# EAGLE design PBC_SISTEMA_ADQUISICION (EAGLE 9.6.2)
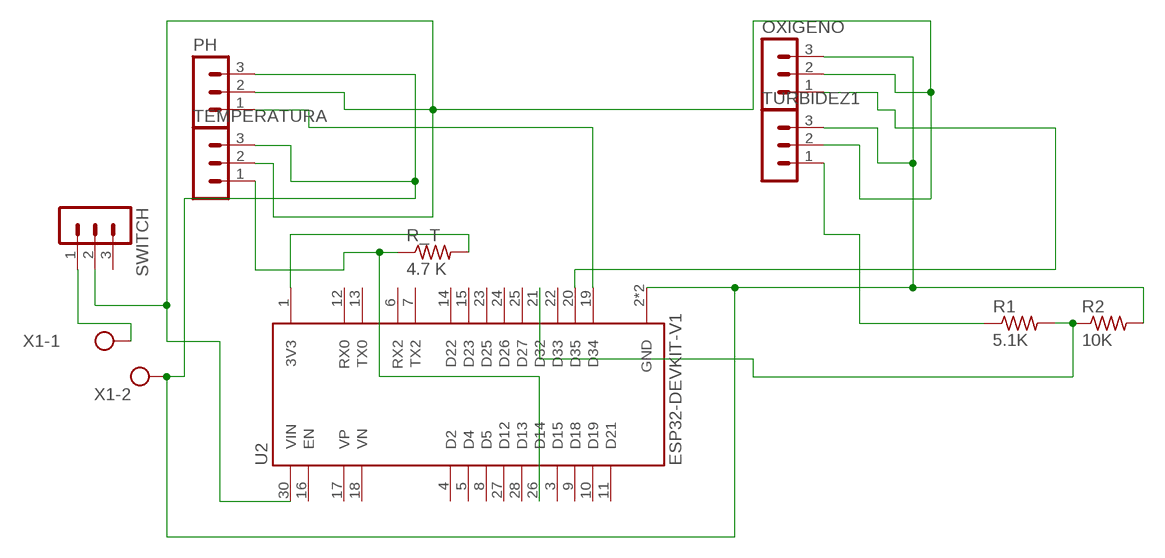
[diagram p0: schematic, sheet 1]

## Parts
OXIGENO  MA03-1  [MA03-1]
PH  MA03-1  [MA03-1]
R1  5.1K  R-US_0207/7  [0207/7]
R2  10K  R-US_0207/7  [0207/7]
R_T  4.7 K  R-US_0207/7  [0207/7]
SWITCH  MA03-1  [MA03-1]
TEMPERATURA  MA03-1  [MA03-1]
TURBIDEZ1  MA03-1  [MA03-1]
U2  ESP32-DEVKIT-V1  [MODULE_ESP32_DEVKIT_V1]
X1  W237-102  [W237-102]

## Nets
GND: OXIGENO.3 PH.3 R2.2 TEMPERATURA.3 TURBIDEZ1.3 U2.2(GND) U2.29(GND) X1.2
N$2: R1.2 R2.1 U2.21(D32)
N$3: OXIGENO.2 PH.2 SWITCH.2 TEMPERATURA.2 TURBIDEZ1.2 U2.30(VIN)
N$4: OXIGENO.1 U2.20(D35)
N$5: R1.1 TURBIDEZ1.1
N$6: PH.1 U2.19(D34)
N$7: R_T.2 U2.1(3V3)
N$9: R_T.1 TEMPERATURA.1 U2.26(D14)
N$13: SWITCH.1 X1.1
Unconnected: SWITCH.3 U2.3(D15) U2.4(D2) U2.5(D4) U2.6(RX2) U2.7(TX2) U2.8(D5) U2.9(D18) U2.10(D19) U2.11(D21) U2.12(RX0) U2.13(TX0) U2.14(D22) U2.15(D23) U2.16(EN) U2.17(VP) U2.18(VN) U2.22(D33) U2.23(D25) U2.24(D26) U2.25(D27) U2.27(D12) U2.28(D13)

## Library data of the parts
OXIGENO PH SWITCH TEMPERATURA TURBIDEZ1 = con-lstb:MA03-1: PIN HEADER; OC_FARNELL: unknown; OC_NEWARK: unknown
R1 R2 R_T = rcl:R-US_: RESISTOR, American symbol; SPICEPREFIX: R
U2 = ESP32-DEVKIT-V1:ESP32-DEVKIT-V1: Check availability <https://pricing.snapeda.com/parts/ESP32-DEVKIT-V1/Do%20it/view-part?ref=eda>; AVAILABILITY: Not in stock; CHECK_PRICES: https://www.snapeda.com/parts/ESP32-DEVKIT-V1/Do+it/view-part/?ref=eda; DESCRIPTION: Dual core, Wi-Fi: 2.4 GHz up to 150 Mbits/s,BLE (Bluetooth Low Energy) and legacy Bluetooth, 32 bits, Up to 240 MHz; MF: Do it; MP: ESP32-DEVKIT-V1; PACKAGE: None; PRICE: None; SNAPEDA_LINK: https://www.snapeda.com/parts/ESP32-DEVKIT-V1/Do+it/view-part/?ref=snap
X1 = con-wago-500:W237-102: WAGO SCREW CLAMP; MPN: 237-102; OC_FARNELL: unknown; OC_NEWARK: 70K9898

## Board
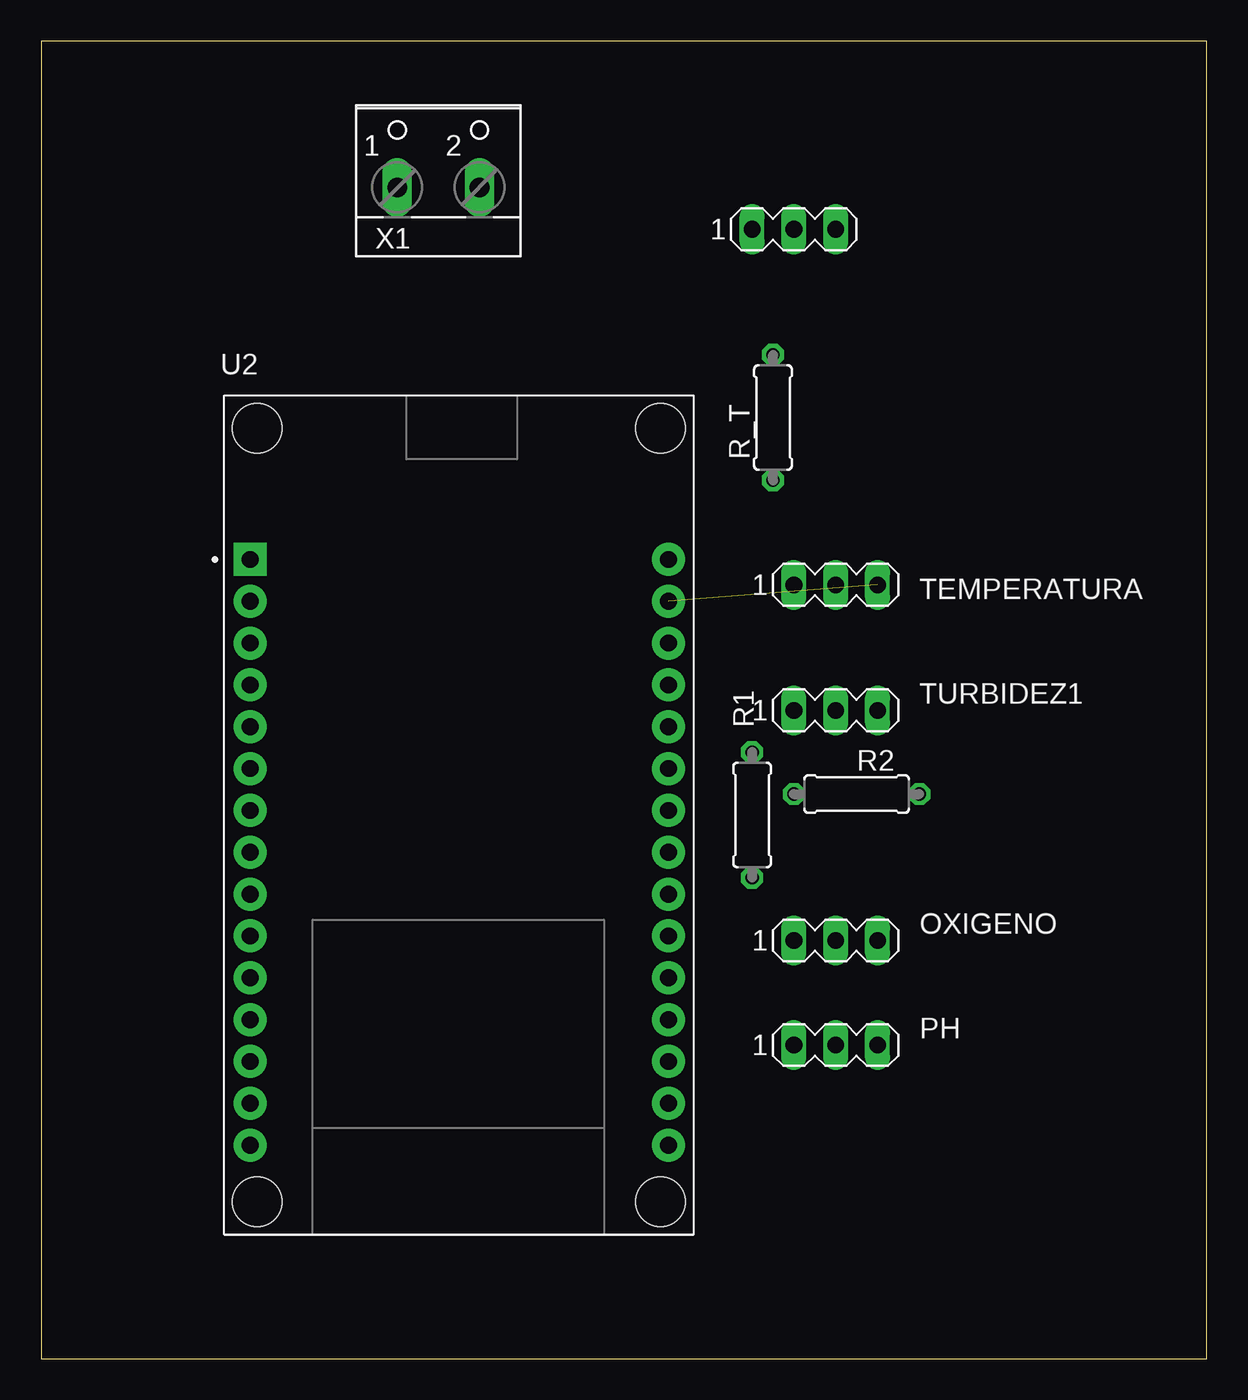
[diagram p1: board, top side]
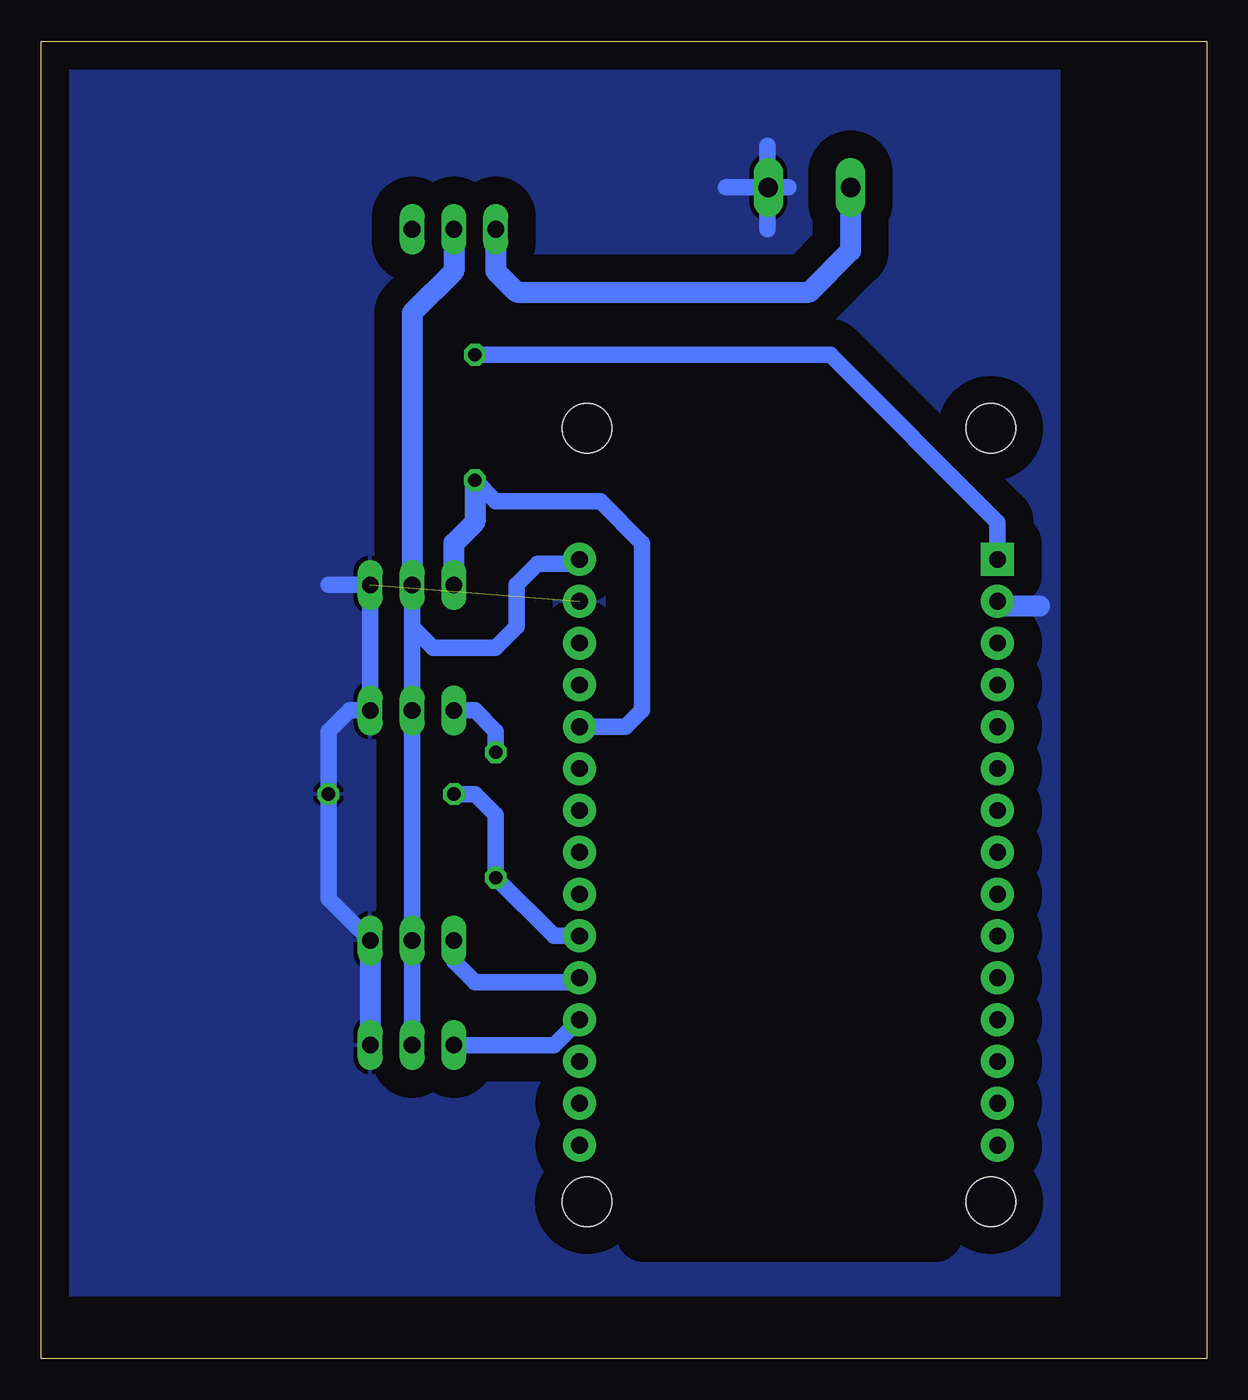
[diagram p2: board, bottom side, seen from below]

Size 70.79 x 80 mm. Coordinates in mm from the lower left corner, seen from the top.
Outline: 0,0 70.79,0 70.79,80 0,80 0,0
Copper layers (1*16): Top 0.035mm / dielectric 1.5mm / Bottom 0.035mm
Design rules "default *": minimum track width 6mil, minimum drill 0.35mm, track to track 6mil, track to pad 6mil, pad to pad 6mil, via to via 6mil, smd to smd 6mil, copper to edge 40mil, drill to drill 6mil, minimum pad ring 10mil, minimum via ring 8mil, stop-mask expansion 4mil, vias tented up to drill 0mil, thermal gap 10mil

### Footprints (pad centres in the part's own frame; a part is rotated, then mirrored left to right if it is on the bottom)
MA03-1 = drill 1.016 long: 1 -2.54,0; 2 0,0; 3 2.54,0
0207/7 = drill 0.813 octagon: 1 -3.81,0; 2 3.81,0
MODULE_ESP32_DEVKIT_V1 = drill 1.02 pad 2 square: 1 -12.7,15.515 | drill 1.02 pad 2: 2 -12.7,12.975; 3 -12.7,10.435; 4 -12.7,7.895; 5 -12.7,5.355; 6 -12.7,2.815; 7 -12.7,0.275; 8 -12.7,-2.265; 9 -12.7,-4.805; 10 -12.7,-7.345; 11 -12.7,-9.885; 12 -12.7,-12.425; 13 -12.7,-14.965; 14 -12.7,-17.505; 15 -12.7,-20.045; 16 12.7,-20.045; 17 12.7,-17.505; 18 12.7,-14.965; 19 12.7,-12.425; 20 12.7,-9.885; 21 12.7,-7.345; 22 12.7,-4.805; 23 12.7,-2.265; 24 12.7,0.275; 25 12.7,2.815; 26 12.7,5.355; 27 12.7,7.895; 28 12.7,10.435; 29 12.7,12.975; 30 12.7,15.515 | hole 3: -12.28,-23.475; 12.23,-23.475; 12.23,23.475; -12.28,23.475
W237-102 = drill 1.194 long: 1 -2.5,-1.27; 2 2.5,-1.27

### Placement (x,y rotation side)
OXIGENO  48.26,25.4 0 top
PH  48.26,19.05 0 top
R1  43.18,33.02 270 top
R2  49.53,34.29 0 top
R_T  44.45,57.15 90 top
SWITCH  45.72,68.58 0 top
TEMPERATURA  48.26,46.99 0 top
TURBIDEZ1  48.26,39.37 0 top
U2  25.4,33.02 0 top
X1  24.13,72.39 0 top

### Tracks (layer width: path | path; a pad name or v marks a point on that pad's centre or on a via)
GND  (1 unrouted)
  Bottom 1.016: OXIGENO.3 53.34,27.94 R2.2 53.34,38.1 52.07,39.37 TURBIDEZ1.3 TEMPERATURA.3 53.34,46.99 | X1.2 26.67,71.08 26.67,68.58 | X1.2 26.67,71.16 26.67,73.66 | X1.2 29.21,71.12 | X1.2 25.4,71.12
  Bottom 1.27: U2.29 38.1,45.72 | OXIGENO.3 PH.3 | U2.2 12.43,45.72 10.16,45.72
  pour Bottom (isolate 1.676): 8.89,78.74 8.89,3.81 69.85,3.81 69.85,78.74
N$2
  Bottom 1.016: U2.21 39.65,25.68 R1.2 43.18,33.02 44.45,34.29 R2.1
N$3
  Bottom 1.016: TEMPERATURA.2 48.26,44.45 | 48.26,44.45 TURBIDEZ1.2 OXIGENO.2 PH.2 | U2.30 38.38,48.26 40.64,48.26 41.91,46.99 41.91,44.45 43.18,43.18 46.99,43.18 48.26,44.45
  Bottom 1.27: TEMPERATURA.2 48.26,63.5 45.72,66.04 SWITCH.2
N$4
  Bottom 1.016: U2.20 38.38,22.86 44.45,22.86 45.72,24.13 OXIGENO.1
N$5
  Bottom 1.016: R1.1 43.18,38.1 44.45,39.37 TURBIDEZ1.1
N$6
  Bottom 1.016: U2.19 39.65,19.05 PH.1
N$7
  Bottom 1.016: U2.1 12.7,50.8 22.86,60.96 R_T.2
N$9
  Bottom 1.016: U2.26 35.28,38.38 34.29,39.37 34.29,49.53 36.83,52.07 43.18,52.07 R_T.1
  Bottom 1.27: R_T.1 44.45,50.8 45.72,49.53 TEMPERATURA.1
N$13
  Bottom 1.27: X1.1 21.63,67.27 24.13,64.77 41.91,64.77 43.18,66.04 SWITCH.1